# Altium schematic sheet IR-LED-DRIVER.SchDoc
size A4; SheetNumber: 7; SheetTotal: 7
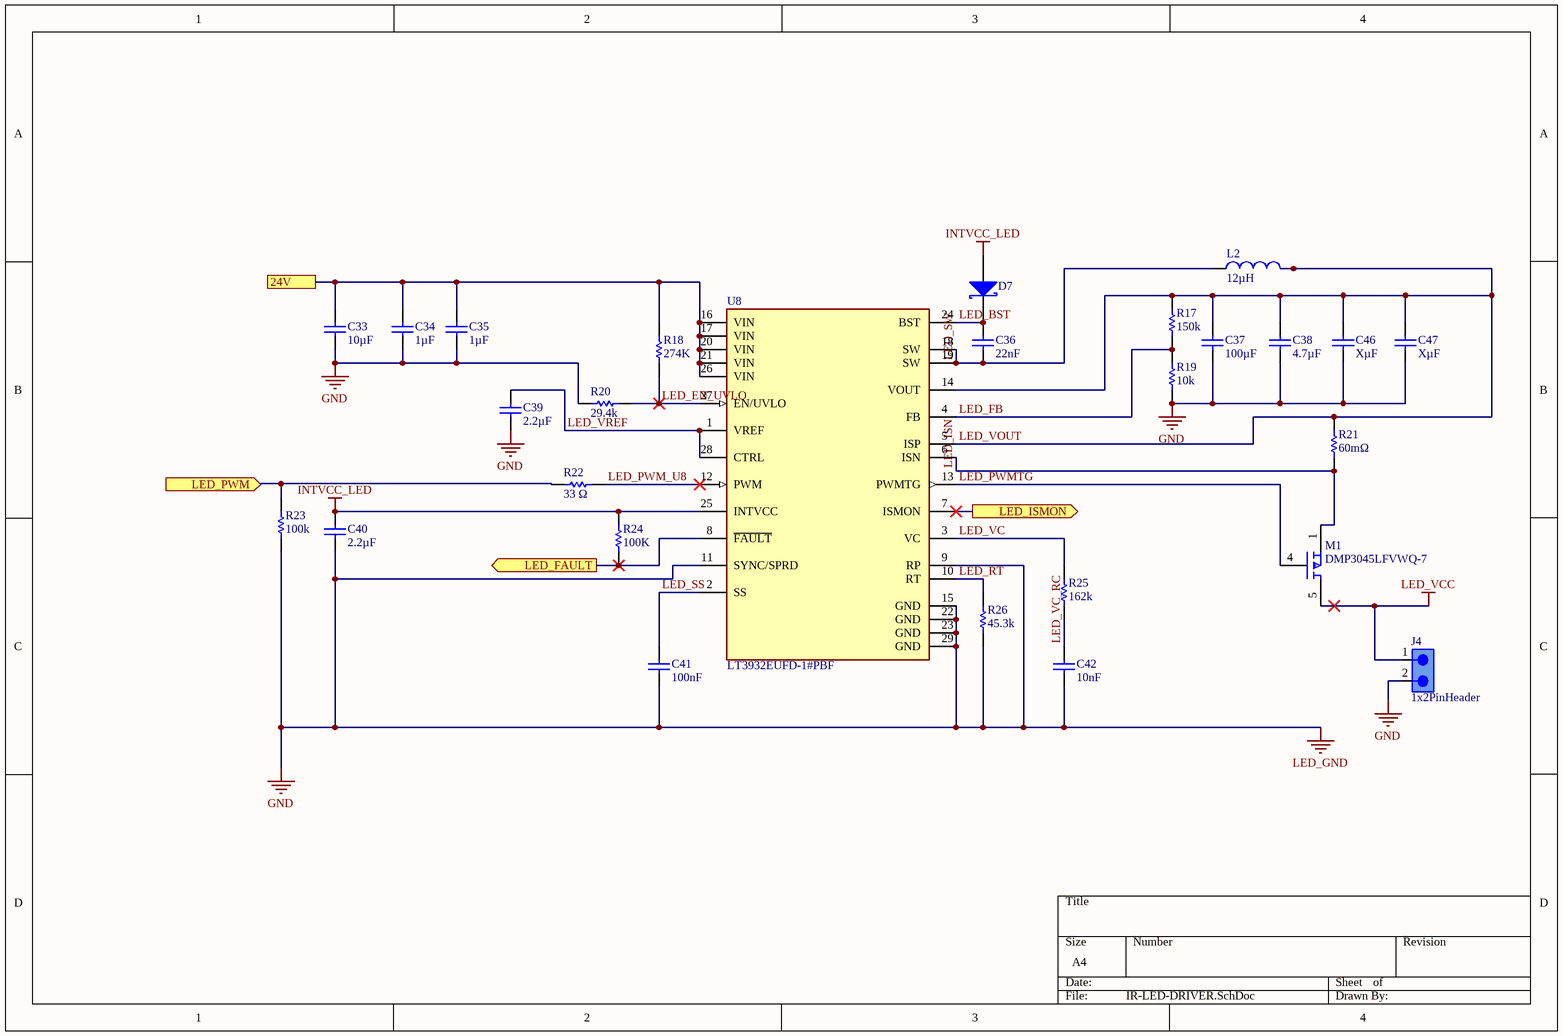
[diagram p0: IR-LED-DRIVER.SchDoc]

## Parts
C33  value 10µF  [1210_CAP]  (hidden comment: Capacitor)
C34  value 1µF  [0805_CAP]  (hidden comment: Capacitor)
C35  value 1µF  [0805_CAP]  (hidden comment: Capacitor)
C36  value 22nF  [0603_CAP]  (hidden comment: Capacitor)
C37  value 100µF  [CAP_EEH-ZC1E101XP]  (hidden comment: Capacitor)
C38  value 4.7µF  [1210_CAP]  (hidden comment: Capacitor)
C39  value 2.2µF  [0603_CAP]  (hidden comment: Capacitor)
C40  value 2.2µF  [0603_CAP]  (hidden comment: Capacitor)
C41  value 100nF  [0603_CAP]  (hidden comment: Capacitor)
C42  value 10nF  [0603_CAP]  (hidden comment: Capacitor)
C46  value XµF  [1210_CAP]  (hidden comment: Capacitor)
C47  value XµF  [1210_CAP]  (hidden comment: Capacitor)
D7  BAT46WJ,115  [SC-90_SOD323F_NEX]  (value not drawn)
J4  1x2PinHeader  [1x2PinHeader]
L2  value 12µH  [IND_SRP1038WA-6R8M_BRN]  (hidden comment: Inductor)
M1  DMP3045LFVWQ-7  [PowerDI3333-8_PMOS]
R17  value 150k  [0603_RES]  (hidden comment: Resistor)
R18  value 274K  [0603_RES]  (hidden comment: Resistor)
R19  value 10k  [0603_RES]  (hidden comment: Resistor)
R20  value 29.4k  [0603_RES]  (hidden comment: Resistor)
R21  value 60mΩ  [1206_RES]  (hidden comment: Resistor)
R22  value 33 Ω  [0603_RES]  (hidden comment: Resistor)
R23  value 100k  [0603_RES]  (hidden comment: Resistor)
R24  value 100K  [0603_RES]  (hidden comment: Resistor)
R25  value 162k  [0603_RES]  (hidden comment: Resistor)
R26  value 45.3k  [0603_RES]  (hidden comment: Resistor)
U8  LT3932EUFD-1#PBF  [FP-UFD-28-05-08-1712-IPC_C]

## Ports
24V (see TOP-LEVEL[4D], POWER[2A]), LED_FAULT (out, see TOP-LEVEL[4C], MCU[2B]), LED_ISMON (out, see TOP-LEVEL[4D], MCU[2C]), LED_PWM (in, see TOP-LEVEL[4D], MCU[1B])

## Nets
GND: C33.2 C34.2 C35.2 C37.2 C38.2 C39.2 C40.2 C41.2 C42.2 C46.2 C47.2 J4.2 R19.1 R20.2 R23.2 R26.1 U8.9(RP) U8.11(SYNC/SPRD) U8.15(GND) U8.22(GND) U8.23(GND) U8.29(GND)  [also labelled LED_GND]
INTVCC_LED: C40.1 D7.1(A) R24.2 U8.25(INTVCC)
LED_VCC: J4.1 M1.5(D)
24V: C33.1 C34.1 C35.1 R18.2 U8.16(VIN) U8.17(VIN) U8.20(VIN) U8.21(VIN) U8.26(VIN) ; port 24V
LED_BST: C36.1 D7.2(K) U8.24(BST)
LED_EN_UVLO: R18.1 R20.1 U8.27(EN/UVLO)
LED_FAULT: R24.1 U8.8(~{FAULT}) ; port LED_FAULT
LED_FB: R17.1 R19.2 U8.4(FB)
LED_ISMON: U8.7(ISMON) ; port LED_ISMON
LED_ISN: M1.1(S) R21.1 U8.6(ISN)
LED_PWM: R22.1 R23.1 ; port LED_PWM
LED_PWM_U8: R22.2 U8.12(PWM)
LED_PWMTG: M1.4(G) U8.13(PWMTG)
LED_RT: R26.2 U8.10(RT)
LED_SS: C41.1 U8.2(SS)
LED_SW: C36.2 L2.1 U8.18(SW) U8.19(SW)
LED_VC: R25.2 U8.3(VC)
LED_VC_RC: C42.1 R25.1
LED_VOUT: C37.1 C38.1 C46.1 C47.1 L2.2 R17.2 R21.2 U8.5(ISP) U8.14(VOUT)
LED_VREF: C39.1 U8.1(VREF) U8.28(CTRL)

## Library data of the parts
C33-C42 C46 C47 = Capacitor: SimulationGenericComponent: True
D7 = Schottky Diode: AF: 1; BV: 0; BV_MAX: 1e99; EG: 1.11; FC: 0.5; IBV: 0.001; IS: 1e-14; MJSW: 0.33; NTUN: 30; TNOM: 27; XTI: 3; SimulationGenericComponent: True; CJO: 0; CJP: 0; CTA: 0; CTP: 0; FCS: 0.5; FV_MAX: 1e99; IKF: 0; IKR: 0; ISR: 1e-14; JSW: 0; JTUN: 0; JTUNSW: 0; KEG: 1; KF: 0; LEVEL: 1; N: 1; NBV: 1; NR: 1; NS: 1; PHP: 1; RS: 0; TCV: 0; TLEV: 0; TLEVC: 0; TM1: 0; TM2: 0; TPB: 0; TPHP: 0; TRS: 0; TRS2: 0; TT: 0; TTT1: 0; TTT2: 0; VJ: 1; XTITUN: 3
L2 = Inductor: SimulationGenericComponent: True
M1 = DMP3045LFVWQ-7: P-channel MOSFET 30V 5.7A, PowerDI3333-8 (pins 1-3 S, 4 G, 5-8 + pad D)
R17-R26 = Resistor: TC1: 0; SimulationGenericComponent: True; TC2: 0
U8 = CMP-09135-000017-1: 40V, 2A MONOLITHIC SYNCHRONOUS S; RoHS Compliant: Yes